# Altium project ProPrj_Project Ignis_2026-06-03.PrjPcb
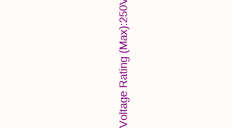
[diagram p0: ProPrj_Project Ignis_2026-06-03.SchDoc, top left]
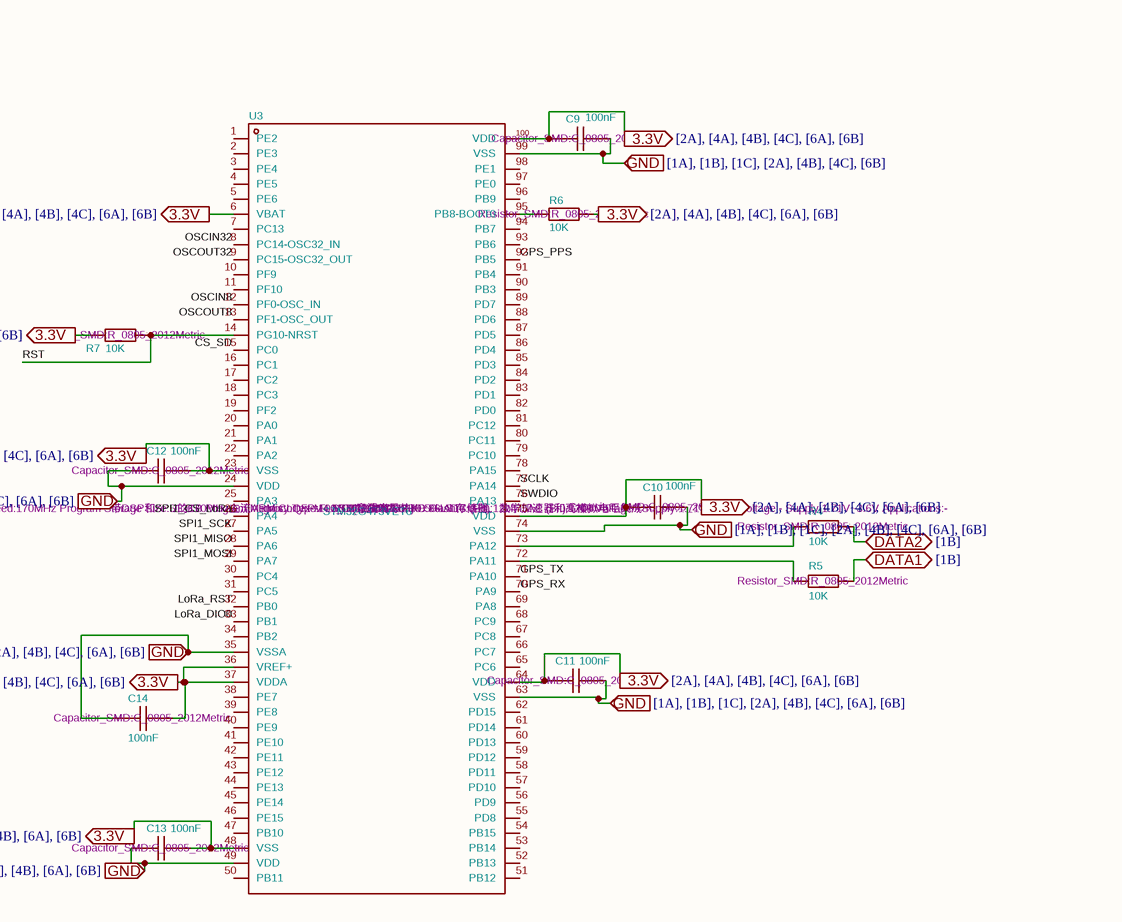
[diagram p1: ProPrj_Project Ignis_2026-06-03.SchDoc, top right]
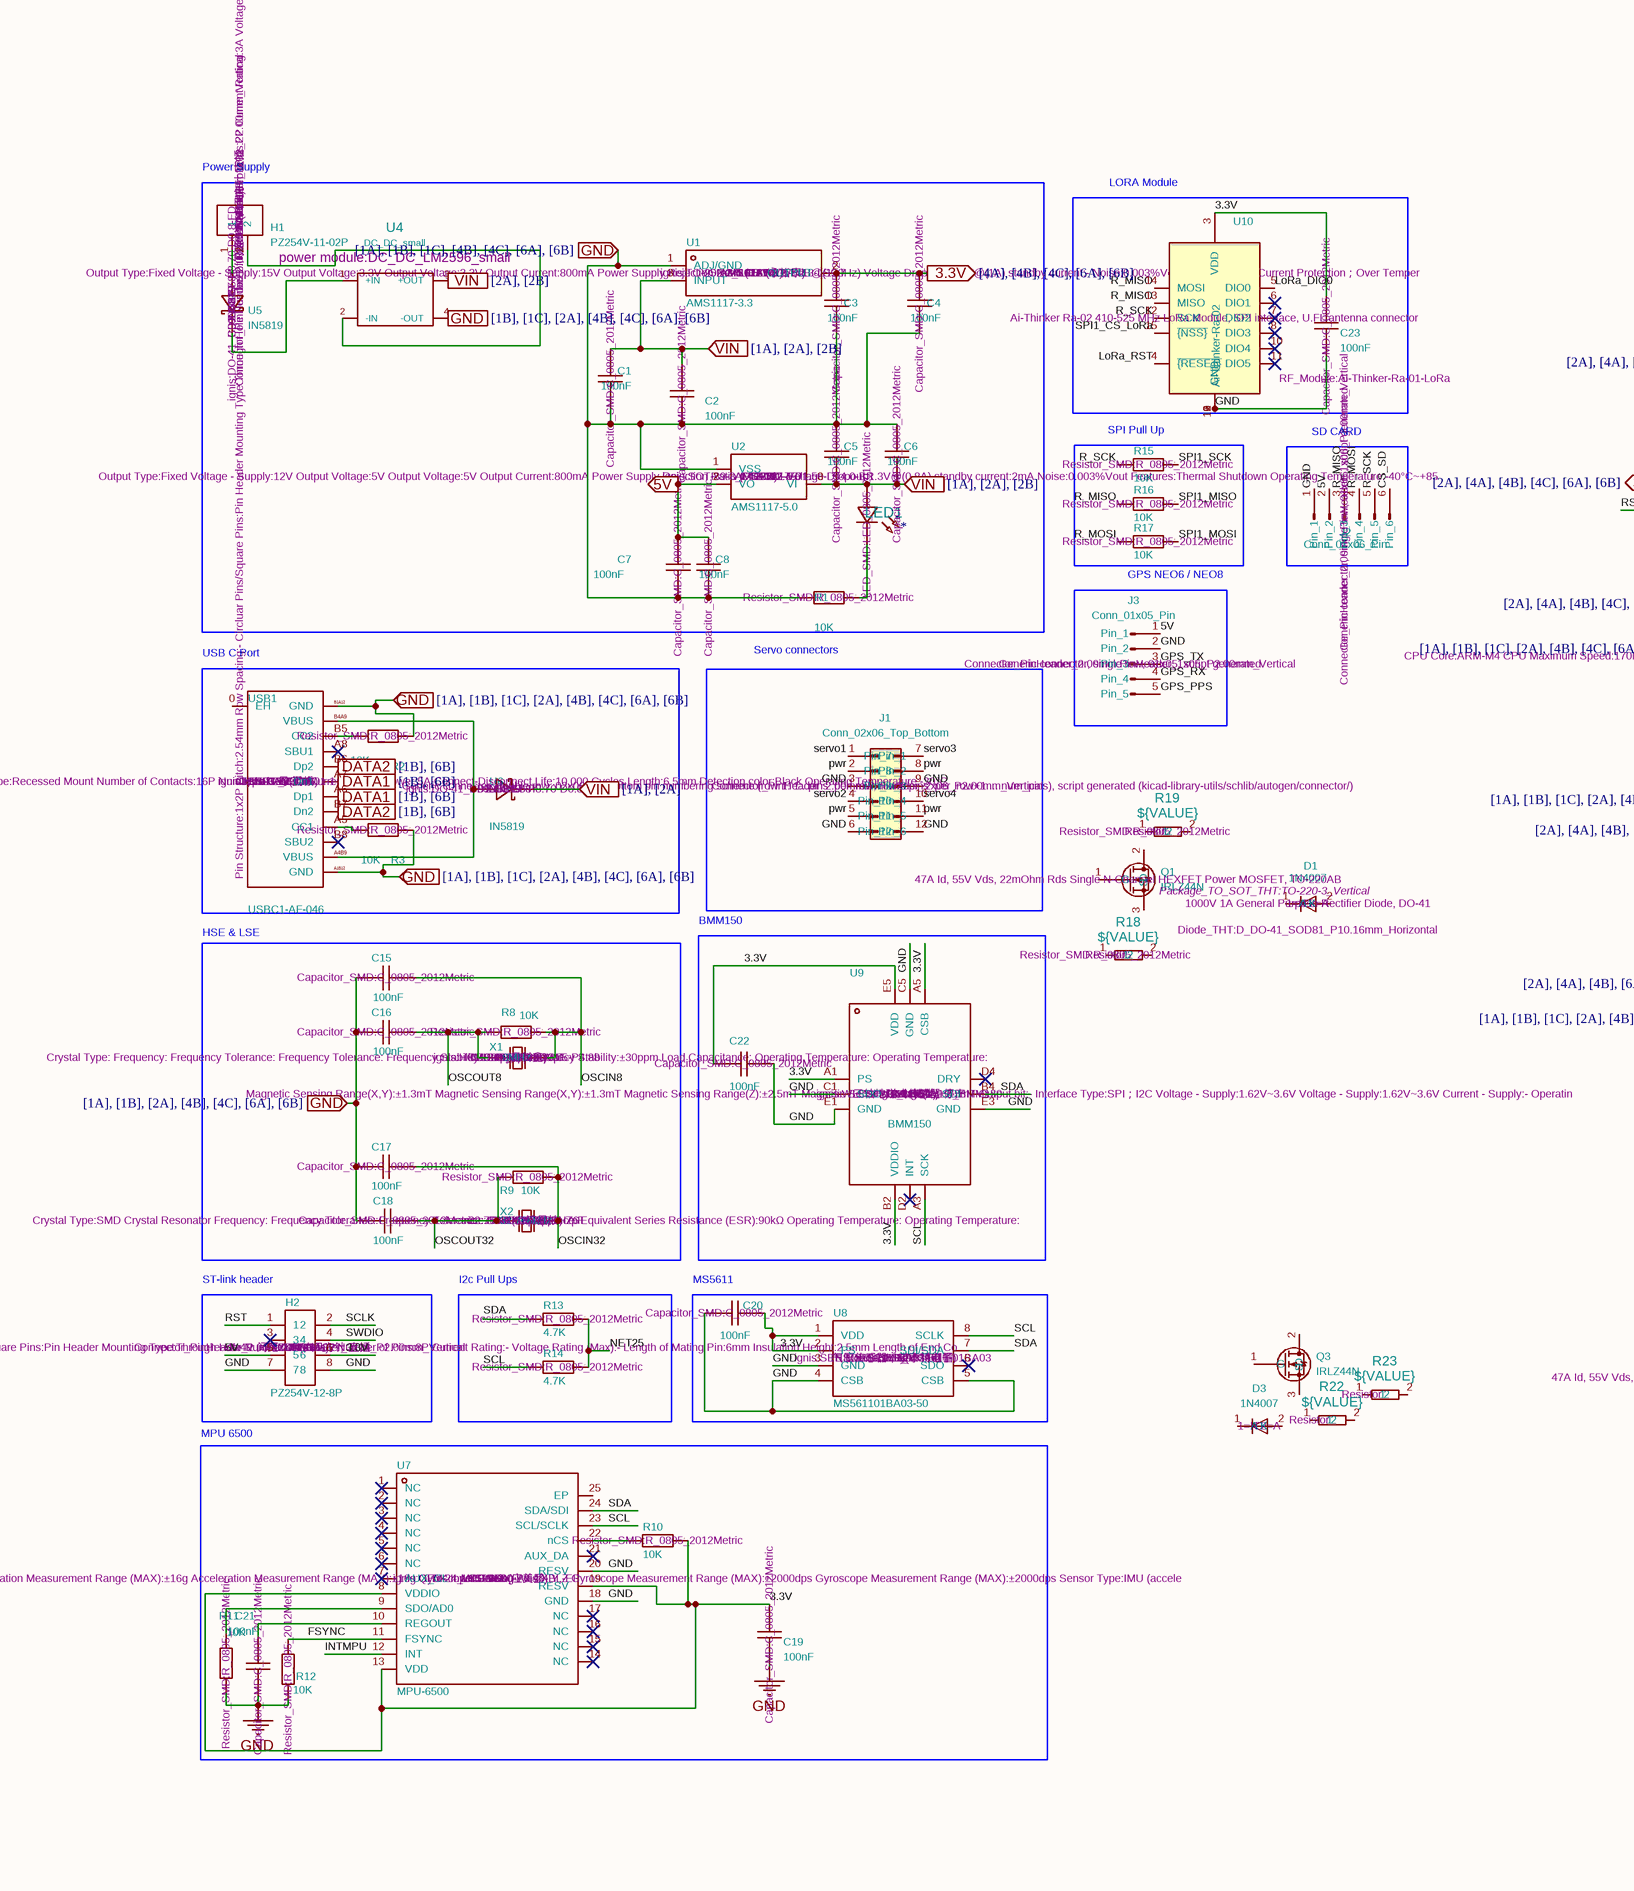
[diagram p2: ProPrj_Project Ignis_2026-06-03.SchDoc, bottom left]
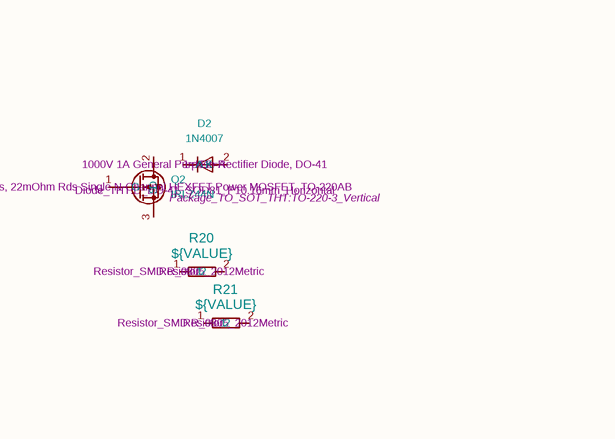
[diagram p3: ProPrj_Project Ignis_2026-06-03.SchDoc, bottom right]
1 sheet, 71 parts. Net scope: flat (ports and power ports of the same name join across sheets).
Board files: ProPrj_Project Ignis_2026-06-03.PcbDoc, ProPrj_Project Ignis_2026-06-03(1).PcbDoc

## Sheet ProPrj_Project Ignis_2026-06-03.SchDoc
size 420 x 297 mm

### Parts
C1  Footprint: Capacitor_SMD:C_0805_2012Metric  [C_0805_2012Metric]  (hidden comment: 100nF)
C2  Footprint: Capacitor_SMD:C_0805_2012Metric  [C_0805_2012Metric]  (hidden comment: 100nF)
C3  Footprint: Capacitor_SMD:C_0805_2012Metric  [C_0805_2012Metric]  (hidden comment: 100nF)
C4  Footprint: Capacitor_SMD:C_0805_2012Metric  [C_0805_2012Metric]  (hidden comment: 100nF)
C5  Footprint: Capacitor_SMD:C_0805_2012Metric  [C_0805_2012Metric]  (hidden comment: 100nF)
C6  Footprint: Capacitor_SMD:C_0805_2012Metric  [C_0805_2012Metric]  (hidden comment: 100nF)
C7  Footprint: Capacitor_SMD:C_0805_2012Metric  [C_0805_2012Metric]  (hidden comment: 100nF)
C8  Footprint: Capacitor_SMD:C_0805_2012Metric  [C_0805_2012Metric]  (hidden comment: 100nF)
C9  Footprint: Capacitor_SMD:C_0805_2012Metric  [C_0805_2012Metric]  (hidden comment: 100nF)
C10  Footprint: Capacitor_SMD:C_0805_2012Metric  [C_0805_2012Metric]  (hidden comment: 100nF)
C11  Footprint: Capacitor_SMD:C_0805_2012Metric  [C_0805_2012Metric]  (hidden comment: 100nF)
C12  Footprint: Capacitor_SMD:C_0805_2012Metric  [C_0805_2012Metric]  (hidden comment: 100nF)
C13  Footprint: Capacitor_SMD:C_0805_2012Metric  [C_0805_2012Metric]  (hidden comment: 100nF)
C14  Footprint: Capacitor_SMD:C_0805_2012Metric  [C_0805_2012Metric]  (hidden comment: 100nF)
C15  Footprint: Capacitor_SMD:C_0805_2012Metric  [C_0805_2012Metric]  (hidden comment: 100nF)
C16  Footprint: Capacitor_SMD:C_0805_2012Metric  [C_0805_2012Metric]  (hidden comment: 100nF)
C17  Footprint: Capacitor_SMD:C_0805_2012Metric  [C_0805_2012Metric]  (hidden comment: 100nF)
C18  Footprint: Capacitor_SMD:C_0805_2012Metric  [C_0805_2012Metric]  (hidden comment: 100nF)
C19  Footprint: Capacitor_SMD:C_0805_2012Metric  [C_0805_2012Metric]  (hidden comment: 100nF)
C20  Footprint: Capacitor_SMD:C_0805_2012Metric  [C_0805_2012Metric]  (hidden comment: 100nF)
C21  Footprint: Capacitor_SMD:C_0805_2012Metric  [C_0805_2012Metric]  (hidden comment: 100nF)
C22  Footprint: Capacitor_SMD:C_0805_2012Metric  [C_0805_2012Metric]  (hidden comment: 100nF)
C23  Footprint: Capacitor_SMD:C_0805_2012Metric  [C_0805_2012Metric]  (hidden comment: 100nF)
D1  Description: 1000V 1A General Purpose Rectifier Diode, DO-41  Sim.Device: D  Sim.Pins: 1=K 2=A  Footprint: Diode_THT:D_DO-41_SOD81_P10.16mm_Horizontal  [D_DO-41_SOD81_P10.16mm_Horizontal]  (hidden comment: 1N4007)
D2  Description: 1000V 1A General Purpose Rectifier Diode, DO-41  Sim.Device: D  Sim.Pins: 1=K 2=A  Footprint: Diode_THT:D_DO-41_SOD81_P10.16mm_Horizontal  [D_DO-41_SOD81_P10.16mm_Horizontal]  (hidden comment: 1N4007)
D3  Sim.Device: D  Sim.Pins: 1=K 2=A  [D_DO-41_SOD81_P10.16mm_Horizontal]  (hidden comment: 1N4007)
H1  Description: Pin Structure:1x2P Pitch:2.54mm Row Spacing:- Circluar Pins/Square Pins:Pin Header Mounting Type:Through Hole Number of Rows:1 Number of Pins:2P Current Rating:3A Voltage Rating (Max):250V Length of Mating Pin:6mm Insulation Height:2.5mm Length of End Con  Manufacturer: XFCN(兴飞)  Supplier Part: C492401  Supplier: LCSC  LCSC Part Name: 1x2P 间距:2.54mm 方针 直插  Footprint: Connector_PinHeader_2.00mm:PinHeader_1x02_P2.00mm_Vertical  [PinHeader_1x02_P2.00mm_Vertical]  (hidden comment: PZ254V-11-02P)
H2  Description: Pin Structure:2x4P Pitch:2.54mm Row Spacing:2.54mm Circluar Pins/Square Pins:Pin Header Mounting Type:Through Hole Number of Rows:2 Number of Pins:8P Current Rating:- Voltage Rating (Max):- Length of Mating Pin:6mm Insulation Height:2.5mm Length of End Co  Manufacturer: XFCN(兴飞)  Supplier Part: C492421  Supplier: LCSC  LCSC Part Name: 2x4P 间距:2.54mm 方针 直插  Footprint: Connector_PinHeader_2.00mm:PinHeader_2x04_P2.00mm_Vertical  [PinHeader_2x04_P2.00mm_Vertical]  (hidden comment: PZ254V-12-8P)
J1  Description: Generic connector, double row, 02x06, top/bottom pin numbering scheme (row 1: 1...pins_per_row, row2: pins_per_row+1 ... num_pins), script generated (kicad-library-utils/schlib/autogen/connector/)  Footprint: Connector_PinHeader_2.00mm:PinHeader_2x06_P2.00mm_Vertical  [PinHeader_2x06_P2.00mm_Vertical]  (hidden comment: Conn_02x06_Top_Bottom)
J2  Description: Generic connector, single row, 01x06, script generated  Footprint: Connector_PinHeader_2.00mm:PinHeader_1x06_P2.00mm_Vertical  [PinHeader_1x06_P2.00mm_Vertical]  (hidden comment: Conn_01x06_Pin)
J3  Description: Generic connector, single row, 01x05, script generated  Footprint: Connector_PinHeader_2.00mm:PinHeader_1x05_P2.00mm_Vertical  [PinHeader_1x05_P2.00mm_Vertical]  (hidden comment: Conn_01x05_Pin)
LED1  *  Footprint: LED_SMD:LED_0805_2012Metric  [LED_0805_2012Metric]
Q1  Description: 47A Id, 55V Vds, 22mOhm Rds Single N-Channel HEXFET Power MOSFET, TO-220AB  Footprint: Package_TO_SOT_THT:TO-220-3_Vertical  [TO-220-3_Vertical]  (hidden comment: IRLZ44N)
Q2  Description: 47A Id, 55V Vds, 22mOhm Rds Single N-Channel HEXFET Power MOSFET, TO-220AB  Footprint: Package_TO_SOT_THT:TO-220-3_Vertical  [TO-220-3_Vertical]  (hidden comment: IRLZ44N)
Q3  IRLZ44N  [TO-220-3_Vertical]
R1  Footprint: Resistor_SMD:R_0805_2012Metric  [R_0805_2012Metric]  (hidden comment: 10K)
R2  Footprint: Resistor_SMD:R_0805_2012Metric  [R_0805_2012Metric]  (hidden comment: 10K)
R3  Footprint: Resistor_SMD:R_0805_2012Metric  [R_0805_2012Metric]  (hidden comment: 10K)
R4  Footprint: Resistor_SMD:R_0805_2012Metric  [R_0805_2012Metric]  (hidden comment: 10K)
R5  Footprint: Resistor_SMD:R_0805_2012Metric  [R_0805_2012Metric]  (hidden comment: 10K)
R6  Footprint: Resistor_SMD:R_0805_2012Metric  [R_0805_2012Metric]  (hidden comment: 10K)
R7  Footprint: Resistor_SMD:R_0805_2012Metric  [R_0805_2012Metric]  (hidden comment: 10K)
R8  Footprint: Resistor_SMD:R_0805_2012Metric  [R_0805_2012Metric]  (hidden comment: 10K)
R9  Footprint: Resistor_SMD:R_0805_2012Metric  [R_0805_2012Metric]  (hidden comment: 10K)
R10  Footprint: Resistor_SMD:R_0805_2012Metric  [R_0805_2012Metric]  (hidden comment: 10K)
R11  Footprint: Resistor_SMD:R_0805_2012Metric  [R_0805_2012Metric]  (hidden comment: 10K)
R12  Footprint: Resistor_SMD:R_0805_2012Metric  [R_0805_2012Metric]  (hidden comment: 10K)
R13  Footprint: Resistor_SMD:R_0805_2012Metric  [R_0805_2012Metric]  (hidden comment: 4.7K)
R14  Footprint: Resistor_SMD:R_0805_2012Metric  [R_0805_2012Metric]  (hidden comment: 4.7K)
R15  Footprint: Resistor_SMD:R_0805_2012Metric  [R_0805_2012Metric]  (hidden comment: 10K)
R16  Footprint: Resistor_SMD:R_0805_2012Metric  [R_0805_2012Metric]  (hidden comment: 10K)
R17  Footprint: Resistor_SMD:R_0805_2012Metric  [R_0805_2012Metric]  (hidden comment: 10K)
R18  Footprint: Resistor_SMD:R_0805_2012Metric  [R_0805_2012Metric]  (hidden comment: ${VALUE})
R19  Footprint: Resistor_SMD:R_0805_2012Metric  [R_0805_2012Metric]  (hidden comment: ${VALUE})
R20  Footprint: Resistor_SMD:R_0805_2012Metric  [R_0805_2012Metric]  (hidden comment: ${VALUE})
R21  Footprint: Resistor_SMD:R_0805_2012Metric  [R_0805_2012Metric]  (hidden comment: ${VALUE})
R22  ${VALUE}  [R_0805_2012Metric]
R23  ${VALUE}  [R_0805_2012Metric]
U1  Description: Output Type:Fixed Voltage - Supply:15V Output Voltage:3.3V Output Voltage:3.3V Output Current:800mA Power Supply Rejection Ratio (PSRR):75dB@(120Hz) Voltage Dropout:1.25V@(1A) standby current:- Noise:0.003%Vout Features:Over Current Protection；Over Temper  Manufacturer: YONGYUTAI(永裕泰)  Supplier Part: C41414107  Supplier: LCSC  Footprint: ignis:TO-252-2_L6.6-W5.6-P2.3-LS9.7  [TO-252-2_L6.6-W5.6-P2.3-LS9.7]  (hidden comment: AMS1117-3.3)
U2  Description: Output Type:Fixed Voltage - Supply:12V Output Voltage:5V Output Voltage:5V Output Current:800mA Power Supply Rejection Ratio (PSRR):- Voltage Dropout:1.3V@(0.8A) standby current:2mA Noise:0.003%Vout Features:Thermal Shutdown Operating Temperature:-40°C~+85  Manufacturer: KUU  Supplier Part: C42387175  Supplier: LCSC  Footprint: ignis:SOT-89-3_L4.5-W2.4-P1.50-LS4.0-BR  [SOT-89-3_L4.5-W2.4-P1.50-LS4.0-BR]  (hidden comment: AMS1117-5.0)
U3  Description: CPU Core:ARM-M4 CPU Maximum Speed:170MHz Program Storage Size:512KB Program Memory Type:FLASH Number of I/O:86 ADC (Bit):12bit DAC (Bit):12bit Voltage - Supply:1.71V~3.6V Voltage - Supply:1.71V~3.6V Applications:-  Manufacturer: ST(意法半导体)  Supplier Part: C730122  Supplier: LCSC  LCSC Part Name: 带DSP和FPU的170MHz主流ARM Cortex-M4 MCU，具有512 KB Flash存储器、数学加速器和高模拟电平集成  Footprint: ignis:LQFP-100_L14.0-W14.0-P0.50-LS16.0-BL  [LQFP-100_L14.0-W14.0-P0.50-LS16.0-BL]  (hidden comment: STM32G473VET6)
U4  Footprint: power module:DC_DC_LM2596_small  [DC_DC_LM2596_small]  (hidden comment: DC_DC_small)
U5  Supplier Part: C9900005587  Supplier: LCSC  Footprint: ignis:DO-41_BD2.4-L4.7-P8.70-D0.8-FD  [DO-41_BD2.4-L4.7-P8.70-D0.8-FD]  (hidden comment: IN5819)
U6  Supplier Part: C9900005587  Supplier: LCSC  Footprint: ignis:DO-41_BD2.4-L4.7-P8.70-D0.8-FD  [DO-41_BD2.4-L4.7-P8.70-D0.8-FD]  (hidden comment: IN5819)
U7  Description: Accelerometer Sensing Axis:X,Y,Z Acceleration Measurement Range (MAX):±16g Acceleration Measurement Range (MAX):±16g Gyroscope Sensing Axis:X,Y,Z Gyroscope Measurement Range (MAX):±2000dps Gyroscope Measurement Range (MAX):±2000dps Sensor Type:IMU (accele  Manufacturer: TDK InvenSense(应美盛)  Supplier Part: C50278  Supplier: LCSC  Footprint: ignis:QFN-24_L3.0-W3.0-P0.40-BL-EP  [QFN-24_L3.0-W3.0-P0.40-BL-EP]  (hidden comment: MPU-6500)
U8  Manufacturer: TE Connectivity(泰科电子)  Supplier Part: C15639  Supplier: LCSC  LCSC Part Name: 气压传感器，带不锈钢帽  Footprint: ignis:SENSORS-SMD_MS5611-01BA03  [SENSORS-SMD_MS5611-01BA03]  (hidden comment: MS561101BA03-50)
U9  Description: Magnetic Sensing Range(X,Y):±1.3mT Magnetic Sensing Range(X,Y):±1.3mT Magnetic Sensing Range(Z):±2.5mT Magnetic Sensing Range(Z):±2.5mT Output bit:- Interface Type:SPI；I2C Voltage - Supply:1.62V~3.6V Voltage - Supply:1.62V~3.6V Current - Supply:- Operatin  Manufacturer: Bosch(博世)  Supplier Part: C171681  Supplier: LCSC  LCSC Part Name: 三轴地磁式传感器 停产  Footprint: ignis:WLCSP-12_L1.6-W1.6_BMM150  [WLCSP-12_L1.6-W1.6_BMM150]  (hidden comment: BMM150)
U10  Description: Ai-Thinker Ra-02 410-525 MHz LoRa Module, SPI interface, U.FL antenna connector  Footprint: RF_Module:Ai-Thinker-Ra-01-LoRa  [Ai-Thinker-Ra-01-LoRa]  (hidden comment: Ai-Thinker-Ra-02)
USB1  Description: Connector Type:Type-C Protocol Standard:USB 3.1 Gender:Female Mounting Type:Recessed Mount Number of Contacts:16P Number of Ports:1 Current Rating-Power:5A Connect-Disconnect Life:10,000 Cycles Length:6.5mm Detection color:Black Operating Temperature:-30°C  Manufacturer: CHIN-BAN(勤本)  Supplier Part: C50305660  Supplier: LCSC  LCSC Part Name: Type-C 母 沉板  Footprint: ignis usb:TE_2340901-1  [TE_2340901-1]  (hidden comment: USBC1-AF-046)
X1  Description: Crystal Type: Frequency: Frequency Tolerance: Frequency Tolerance: Frequency Stability:±30ppm Frequency Stability:±30ppm Load Capacitance: Operating Temperature: Operating Temperature:  Manufacturer: SJK(晶科鑫)  Supplier Part: C252288  Supplier: LCSC  LCSC Part Name: 8MHz ±20ppm 20pF  Footprint: ignis:HC-49US_L11.5-W4.5-P4.88  [HC-49US_L11.5-W4.5-P4.88]  (hidden comment: 8MHz)
X2  Description: Crystal Type:SMD Crystal Resonator Frequency: Frequency Tolerance: Frequency Tolerance: Load Capacitance: Equivalent Series Resistance (ESR):90kΩ Operating Temperature: Operating Temperature:  Manufacturer: TXC(台湾晶技)  Supplier Part: C409339  Supplier: LCSC  LCSC Part Name: 32.768kHz ±20ppm 7pF  Footprint: osc:ABS0532768KHZ6T  [ABS0532768KHZ6T]  (hidden comment: 32.768kHz)

### Blocks framed on the sheet
Power Supply: C1-C8 H1 LED1 R1 U1 U2 U4 U5
LORA Module /: C23 U10
SPI Pull Up /: R15-R17
SD CARD: J2
GPS NEO6 / NEO8: J3
USB C Port: R2 R3 U6 USB1
Servo connectors: J1
HSE & LSE: C15-C18 R8 R9 X1 X2
BMM150: C22 U9
ST-link header: H2
I2c Pull Ups: R13 R14
MS5611: C20 U8
MPU 6500: C19 C21 R10-R12 U7

### Ports
3.3V (out, see [2A], [4A], [4B], [4C], [6A], [6B]), 3.3V (out, see [2A], [4A], [4B], [6A], [6B]), 3.3V (out, see [4A], [4B], [4C], [6A], [6B]), 5V (out), DATA1 (bidir, see [1B]), DATA1 (out, see [1B], [6B]), DATA2 (bidir, see [1B]), DATA2 (out, see [1B], [6B]), GND (in, see [1A], [1B], [1C], [2A], [4B], [4C], [6A], [6B]), GND (in, see [1A], [1B], [1C], [2A], [4B], [4C], [6B]), GND (in, see [1A], [1B], [1C], [2A], [4B], [6A], [6B]), GND (in, see [1A], [1B], [1C], [4B], [4C], [6A], [6B]), GND (in, see [1A], [1B], [2A], [4B], [4C], [6A], [6B]), GND (in, see [1B], [1C], [2A], [4B], [4C], [6A], [6B]), VIN (in, see [1A], [2A]), VIN (in, see [1A], [2A], [2B]), VIN (in, see [2A], [2B])

### Nets
GND: C19.2 C20.2 C21.1 C22.1 C23.2 H2.7 H2.8 J1.3(Pin_3) J1.6(Pin_6) J1.9(Pin_9) J1.12(Pin_12) J2.1(Pin_1) J3.2(Pin_2) R11.1 R12.1 U7.18(GND) U7.20(RESV) U8.3(GND) U8.4(CSB) U8.5(CSB) U9.C1(SDO) U9.C5(GND) U9.E1(GND) U9.E3(GND) U10.1(GND) U10.2(GND) U10.9(GND) U10.16(GND)
3.3V: C3.2 C4.2 C9.2 C10.2 C11.2 C12.1 C13.1 C14.1 R6.2 R7.1 U1.2(OUTPUT) U3.6(VBAT) U3.23(VSS) U3.36(VREF+) U3.37(VDDA) U3.48(VSS) U3.64(VDD) U3.75(VDD) U3.100(VDD) ; port 3.3V
3.3V: C19.1 C20.1 C22.2 C23.1 H2.6 R10.2 U7.8(VDDIO) U7.13(VDD) U7.19(RESV) U8.1(VDD) U8.2(PS) U9.A1(PS) U9.A5(CSB) U9.B2(VDDIO) U9.E5(VDD) U10.3(VDD)  [a separate net that carries the same name]
5V: C7.2 C8.2 U2.2(VO) ; port 5V
5V: H2.5 J2.2(Pin_2) J3.1(Pin_1)  [a separate net that carries the same name]
CS_SD: J2.6(Pin_6) U3.15(PC0)
DATA1: R5.2 USB1.A6(Dp1) USB1.A7(Dn1) ; port DATA1
DATA2: R4.2 USB1.B6(Dp2) USB1.B7(Dn2) ; port DATA2
FSYNC: R12.2 U7.11(FSYNC)
GND: C1.1 C2.2 C3.1 C4.1 C5.2 C6.2 C7.1 C8.1 C9.1 C10.1 C11.1 C12.2 C13.2 C14.2 C15.2 C16.2 C17.2 C18.2 R1.1 R2.2 R3.2 U1.1(ADJ/GND) U2.1(VSS) U3.24(VDD) U3.35(VSSA) U3.49(VDD) U3.63(VSS) U3.74(VSS) U3.99(VSS) U4.4(-OUT) USB1.A1B12(GND) USB1.B1A12(GND) ; port GND  [a separate net that carries the same name]
GPS_PPS: J3.5(Pin_5) U3.92(PB5)
GPS_RX: J3.4(Pin_4) U3.70(PA9)
GPS_TX: J3.3(Pin_3) U3.71(PA10)
INTMPU: U7.12(INT)
LoRa_DIO0: U3.33(PB1) U10.5(DIO0)
LoRa_RST: U3.32(PB0) U10.4(~{{RESET}})
NET25: R13.2 R14.2
OSCIN8: C15.1 R8.2 U3.12(PF0-OSC_IN) X1.2(OSC2)
OSCIN32: C17.1 R9.2 U3.8(PC14-OSC32_IN) X2.2(OSC2)
OSCOUT8: C16.1 R8.1 U3.13(PF1-OSC_OUT) X1.1(OSC1)
OSCOUT32: C18.1 R9.1 U3.9(PC15-OSC32_OUT) X2.1(OSC1)
pwr: J1.2(Pin_2) J1.5(Pin_5) J1.8(Pin_8) J1.11(Pin_11)
R_MISO: J2.3(Pin_3) R16.1 U10.13(MISO) U10.14(MOSI)
R_MOSI: J2.4(Pin_4) R17.1
R_SCK: J2.5(Pin_5) R15.1 U10.12(SCK)
RST: H2.1 R7.2 U3.14(PG10-NRST)
SCL: R14.1 U7.23(SCL/SCLK) U8.8(SCLK) U9.A3(SCK)
SCLK: H2.2 U3.77(PA14)
SDA: R13.1 U7.24(SDA/SDI) U8.7(SDI/SDA) U9.B4(SDI)
servo1: J1.1(Pin_1)
servo2: J1.4(Pin_4)
servo3: J1.7(Pin_7)
servo4: J1.10(Pin_10)
SPI1_CS_LoRa: U3.26(PA4) U10.15(~{{NSS}})
SPI1_MISO: R16.2 U3.28(PA6)
SPI1_MOSI: R17.2 U3.29(PA7)
SPI1_SCK: R15.2 U3.27(PA5)
SWDIO: H2.4 U3.76(PA13)
VIN: C1.2 C2.1 C5.1 C6.1 LED1.1(A) U1.3(INPUT) U2.3(VI) U4.3(+OUT) U6.2(K) ; port VIN
NetC21_2: C21.2 U7.10(REGOUT)
NetH1_1: H1.1 U5.1(A)
NetH1_2: H1.2 U4.2(-IN)
NetLED1_2: LED1.2(C) R1.2
NetR2_1: R2.1 USB1.B5(CC2)
NetR3_1: R3.1 USB1.A5(CC1)
NetR4_1: R4.1 U3.73(PA12)
NetR5_1: R5.1 U3.72(PA11)
NetR6_1: R6.1 U3.95(PB8-BOOT0)
NetR10_1: R10.1 U7.22(nCS)
NetR11_2: R11.2 U7.9(SDO/AD0)
NetU4_1: U4.1(+IN) U5.2(K)
NetU6_1: U6.1(A) USB1.A4B9(VBUS) USB1.B4A9(VBUS)

Not connected (* = marked no-connect by the designer): D1 1(K) 2(A); D2 1(K) 2(A); D3 1(K) 2(A); H2 3*; Q1 1(G) 2(D) 3(S); Q2 1(G) 2(D) 3(S); Q3 1(G) 2(D) 3(S); R18 1 2; R19 1 2; R20 1 2; R21 1 2; R22 1 2; R23 1 2; U3 1(PE2) 2(PE3) 3(PE4) 4(PE5) 5(PE6) 7(PC13) 10(PF9) 11(PF10) 16(PC1) 17(PC2) 18(PC3) 19(PF2) 20(PA0) 21(PA1) 22(PA2) 25(PA3) 30(PC4) 31(PC5) 34(PB2) 38(PE7) 39(PE8) 40(PE9) 41(PE10) 42(PE11) 43(PE12) 44(PE13) 45(PE14) 46(PE15) 47(PB10) 50(PB11) 51(PB12) 52(PB13) 53(PB14) 54(PB15) 55(PD8) 56(PD9) 57(PD10) 58(PD11) 59(PD12) 60(PD13) 61(PD14) 62(PD15) 65(PC6) 66(PC7) 67(PC8) 68(PC9) 69(PA8) 78(PA15) 79(PC10) 80(PC11) 81(PC12) 82(PD0) 83(PD1) 84(PD2) 85(PD3) 86(PD4) 87(PD5) 88(PD6) 89(PD7) 90(PB3) 91(PB4) 93(PB6) 94(PB7) 96(PB9) 97(PE0) 98(PE1); U7 1(NC)* 2(NC)* 3(NC)* 4(NC)* 5(NC)* 6(NC)* 7(AUX_CL)* 14(NC)* 15(NC)* 16(NC)* 17(NC)* 21(AUX_DA)* 25(EP); U8 6(SDO)*; U9 D2(INT)* D4(DRY)*; U10 6(DIO1)* 7(DIO2)* 8(DIO3)* 10(DIO4)* 11(DIO5)*; USB1 0(EH) A8(SBU1)* B8(SBU2)*

### Notes on the sheet
- 1
- 2
- 3
- 4
- 5
- 6
- 7
- 8
- A
- B
- C
- D
- E
- Title: IGNIS CORE
- File: ProPrj_Project Ignis_2026-06-03.kicad_sch
- Sheet: /
- Shourya Pandey
- F
- KiCad E.D.A.  kicad (5.1.4)-1
- Size: A3
- Date:
- Rev:
- Id: 1/1

### Library data of the parts
C1-C23 = CAP: Value: 100nF
LED1 = LED_R
R1-R17 = Res
  R1-R12 R15-R17: Value: 10K
  R13 R14: Value: 4.7K
R18-R23 = Resistor: Description: Resistor; Value: ${VALUE}
U1 = AMS1117-3.3_C41414107: Manufacturer Part: AMS1117-3.3; LCSC Part Name: AMS1117-3.3; Value: AMS1117-3.3
U2 = AMS1117-5.0_C42387175: Manufacturer Part: AMS1117-5.0; LCSC Part Name: AMS1117-5.0; Value: AMS1117-5.0
U7 = MPU6500: Manufacturer Part: MPU-6500; LCSC Part Name: MPU-6500; Value: MPU-6500
X1 = 6BS08000F20UCG: Manufacturer Part: 6BS08000F20UCG; Value: 8MHz
X2 = 9H03200028: Manufacturer Part: 9H03200028; Value: 32.768kHz
D1-D3 = 1N4007: Value: 1N4007
H1 = PZ254V-11-02P: Manufacturer Part: PZ254V-11-02P; Value: PZ254V-11-02P
H2 = PZ254V-12-8P: Manufacturer Part: PZ254V-12-8P; Value: PZ254V-12-8P
J1 = Conn_02x06_Top_Bottom: Value: Conn_02x06_Top_Bottom
J2 = Conn_01x06_Pin: Value: Conn_01x06_Pin
J3 = Conn_01x05_Pin: Value: Conn_01x05_Pin
Q1-Q3 = IRLZ44N: Value: IRLZ44N
U3 = STM32G473VET6: Manufacturer Part: STM32G473VET6; Value: STM32G473VET6
U4 = DC_DC_small: Value: DC_DC_small
U5 U6 = IN5819: Manufacturer Part: IN5819; LCSC Part Name: IN5819; Value: IN5819
U8 = MS561101BA03-50: Manufacturer Part: MS561101BA03-50; Value: MS561101BA03-50
U9 = BMM150: Manufacturer Part: BMM150; Value: BMM150
U10 = Ai-Thinker-Ra-02: Value: Ai-Thinker-Ra-02
USB1 = USBC1-AF-046: Manufacturer Part: USBC1-AF-046; Value: USBC1-AF-046